# Altium schematic sheet Top Sheet.SchDoc
size A4; DocumentNumber: 1; SheetNumber: 1; SheetTotal: 6
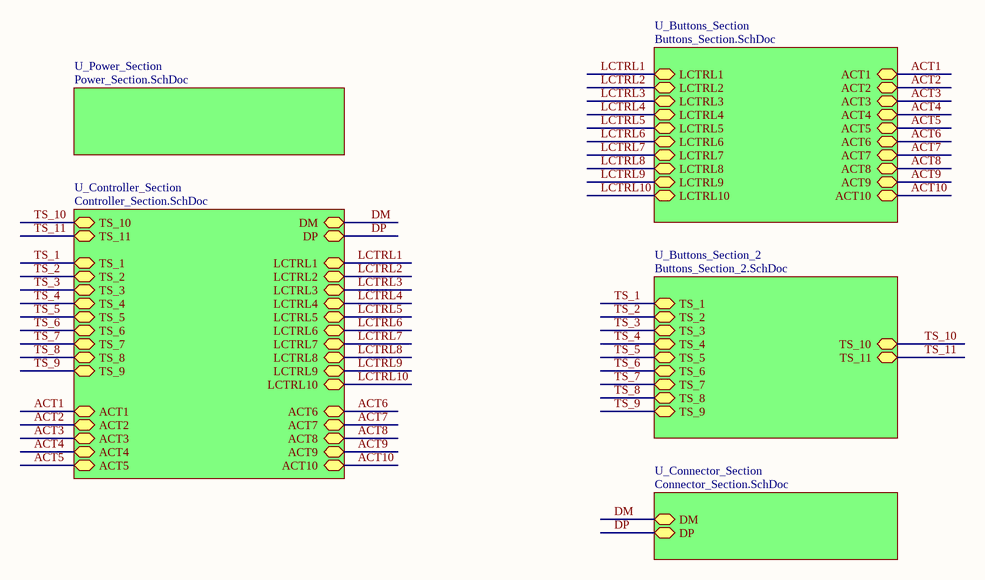
[diagram p0: Top Sheet.SchDoc]

## Sub-sheets
U_Buttons_Section = Buttons_Section.SchDoc: ACT9 (bidir), LCTRL8 (bidir), ACT4 (bidir), ACT3 (bidir), LCTRL5 (bidir), ACT2 (bidir), LCTRL4 (bidir), LCTRL7 (bidir), ACT6 (bidir), LCTRL2 (bidir), LCTRL6 (bidir), LCTRL9 (bidir), ACT1 (bidir), ACT8 (bidir), ACT7 (bidir), ACT10 (bidir), ACT5 (bidir), LCTRL3 (bidir), LCTRL1 (bidir), LCTRL10 (bidir)
U_Buttons_Section_2 = Buttons_Section_2.SchDoc: TS_6 (bidir), TS_8 (bidir), TS_9 (bidir), TS_5 (bidir), TS_2 (bidir), TS_7 (bidir), TS_4 (bidir), TS_1 (bidir), TS_3 (bidir), TS_10 (bidir), TS_11 (bidir)
U_Connector_Section = Connector_Section.SchDoc: DM (bidir), DP (bidir)
U_Controller_Section = Controller_Section.SchDoc: ACT6 (bidir), LCTRL5 (bidir), ACT10 (bidir), LCTRL1 (bidir), ACT8 (bidir), LCTRL4 (bidir), ACT5 (bidir), ACT9 (bidir), ACT1 (bidir), LCTRL2 (bidir), LCTRL6 (bidir), ACT3 (bidir), ACT2 (bidir), LCTRL3 (bidir), ACT4 (bidir), DM (bidir), DP (bidir), ACT7 (bidir), LCTRL7 (bidir), LCTRL10 (bidir), LCTRL9 (bidir), LCTRL8 (bidir), TS_8 (bidir), TS_7 (bidir), TS_9 (bidir), TS_6 (bidir), TS_5 (bidir), TS_4 (bidir), TS_3 (bidir), TS_2 (bidir), TS_1 (bidir), TS_10 (bidir), TS_11 (bidir)
U_Power_Section = Power_Section.SchDoc: no entries

## Nets
ACT1: sheet U_Controller_Section/ACT1, sheet U_Buttons_Section/ACT1
ACT2: sheet U_Controller_Section/ACT2, sheet U_Buttons_Section/ACT2
ACT3: sheet U_Controller_Section/ACT3, sheet U_Buttons_Section/ACT3
ACT4: sheet U_Controller_Section/ACT4, sheet U_Buttons_Section/ACT4
ACT5: sheet U_Controller_Section/ACT5, sheet U_Buttons_Section/ACT5
ACT6: sheet U_Controller_Section/ACT6, sheet U_Buttons_Section/ACT6
ACT7: sheet U_Controller_Section/ACT7, sheet U_Buttons_Section/ACT7
ACT8: sheet U_Controller_Section/ACT8, sheet U_Buttons_Section/ACT8
ACT9: sheet U_Controller_Section/ACT9, sheet U_Buttons_Section/ACT9
ACT10: sheet U_Controller_Section/ACT10, sheet U_Buttons_Section/ACT10
DM: sheet U_Controller_Section/DM, sheet U_Connector_Section/DM
DP: sheet U_Controller_Section/DP, sheet U_Connector_Section/DP
LCTRL1: sheet U_Controller_Section/LCTRL1, sheet U_Buttons_Section/LCTRL1
LCTRL2: sheet U_Controller_Section/LCTRL2, sheet U_Buttons_Section/LCTRL2
LCTRL3: sheet U_Controller_Section/LCTRL3, sheet U_Buttons_Section/LCTRL3
LCTRL4: sheet U_Controller_Section/LCTRL4, sheet U_Buttons_Section/LCTRL4
LCTRL5: sheet U_Controller_Section/LCTRL5, sheet U_Buttons_Section/LCTRL5
LCTRL6: sheet U_Controller_Section/LCTRL6, sheet U_Buttons_Section/LCTRL6
LCTRL7: sheet U_Controller_Section/LCTRL7, sheet U_Buttons_Section/LCTRL7
LCTRL8: sheet U_Controller_Section/LCTRL8, sheet U_Buttons_Section/LCTRL8
LCTRL9: sheet U_Controller_Section/LCTRL9, sheet U_Buttons_Section/LCTRL9
LCTRL10: sheet U_Controller_Section/LCTRL10, sheet U_Buttons_Section/LCTRL10
TS_1: sheet U_Controller_Section/TS_1, sheet U_Buttons_Section_2/TS_1
TS_2: sheet U_Controller_Section/TS_2, sheet U_Buttons_Section_2/TS_2
TS_3: sheet U_Controller_Section/TS_3, sheet U_Buttons_Section_2/TS_3
TS_4: sheet U_Controller_Section/TS_4, sheet U_Buttons_Section_2/TS_4
TS_5: sheet U_Controller_Section/TS_5, sheet U_Buttons_Section_2/TS_5
TS_6: sheet U_Controller_Section/TS_6, sheet U_Buttons_Section_2/TS_6
TS_7: sheet U_Controller_Section/TS_7, sheet U_Buttons_Section_2/TS_7
TS_8: sheet U_Controller_Section/TS_8, sheet U_Buttons_Section_2/TS_8
TS_9: sheet U_Controller_Section/TS_9, sheet U_Buttons_Section_2/TS_9
TS_10: sheet U_Controller_Section/TS_10, sheet U_Buttons_Section_2/TS_10
TS_11: sheet U_Controller_Section/TS_11, sheet U_Buttons_Section_2/TS_11